# EasyEDA Pro project honglin-first_crt_smartphone-e4cb491d.epro, board 灯板2
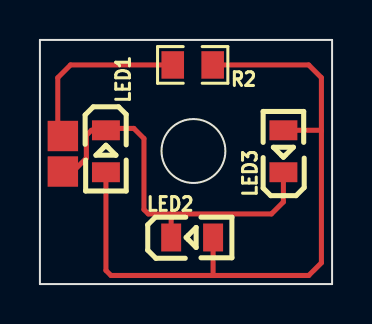
[diagram p11: board, top side]
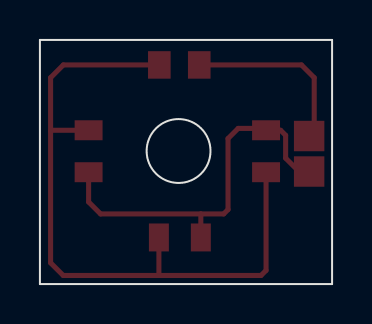
[diagram p12: board, bottom side, seen from below]

Outline 14.64 x 12.23 mm; copper layers: Top Layer, Bottom Layer. Coordinates in mm from the lower left corner of the outline.
Outline path: circle c7.69,6.66 r1.6 ; 0,12.23 14.64,12.23 14.64,0 0,0 0,12.23
Stack: Top Layer 0.035mm / Dielectric1 1.51mm FR4 er 4.5 / Bottom Layer 0.035mm

## Design rules (mm)
spacing copperThickness1oz (default): track to track 0.102, other pairs 0.152 to 0.3
spacing copperThickness2oz: track to track 0.203, other pairs 0.152 to 0.3
spacing Plane_innerPlane: track to track 0.102, other pairs 0.152 to 0.3
spacing Copper_copperRegion: track to track 0.102, other pairs 0.152 to 0.3
track width copperThickness1oz (default): min 0.127, default 0.254, max 2.54
track width copperThickness2oz: min 0.203, default 0.254, max 2.54
differential pair differentialPair (default): width min 0.127, default 0.254, max 2.54; gap min 0.152, default 0.152

## Placement (name value [footprint] x y rotation side)
LED1  KT-0805G  [LED0805-R-RD]  3.31 6.65 270 top
LED2  KT-0805G  [LED0805-R-RD]  7.63 2.33 0 top
LED3  KT-0805G  [LED0805-R-RD]  12.2 6.65 90 top
NOREF  -  [Pad_e2]  1.15 7.41 0 top
NOREF#2  -  [Pad_e1]  1.15 5.64 0 top
R2  50Ω  [R0805]  7.65 10.97 180 top

## Footprints (pads in the part's own frame, mm; a bottom-side part is the same pattern mirrored in y, then rotated)
LED0805-R-RD
  rect 1x1.399 smd: 1(1.05,0) 2(-1.05,0)
Pad_e1
  rect 1.524x1.524 smd: 4(0,0)
Pad_e2
  rect 1.524x1.524 smd: 4(0,0)
R0805
  rect 1.133x1.377 smd: 1(-1,0) 2(1,0)

## Nets
GND: LED1.2 LED2.2 LED3.2 NOREF#2.4
VCC: NOREF.4 R2.2
$1N488: LED1.1 LED2.1 LED3.1 R2.1

## Routing (per net, layer and track width the routed paths; a pad name or vN(x,y) marks a point on that pad's centre or on a via; arc(x,y) is an arc through that point)
GND: length 19.4
  Top Layer w0.254: 1.28,5.38 1.4,5.38 2.33,6.31 2.33,7.45 2.58,7.7 LED1.2 3.4,7.8 4.71,7.8 5.21,7.29 5.21,3.73 5.43,3.51 6.58,3.51 ; LED3.2 12.2,4.11 11.6,3.51 6.58,3.51 ; 6.58,3.51 LED2.2
VCC: length 8.4
  Top Layer w0.254: 0.9,7.92 0.9,10.33 1.53,10.97 R2.2
$1N488: length 34.9
  Top Layer w0.254: 8.67,0.43 13.47,0.43 14.1,1.06 14.1,7.67 ; 8.67,0.43 3.56,0.43 3.31,0.68 LED1.1 ; 8.67,0.43 8.68,0.44 LED2.1 ; R2.1 13.46,10.97 14.1,10.33 14.1,7.67 ; LED3.1 14.07,7.7 14.1,7.67
